# Altium schematic sheet Peripheral_Section.SchDoc
size A4; DocumentNumber: 8; SheetNumber: 8; SheetTotal: 17
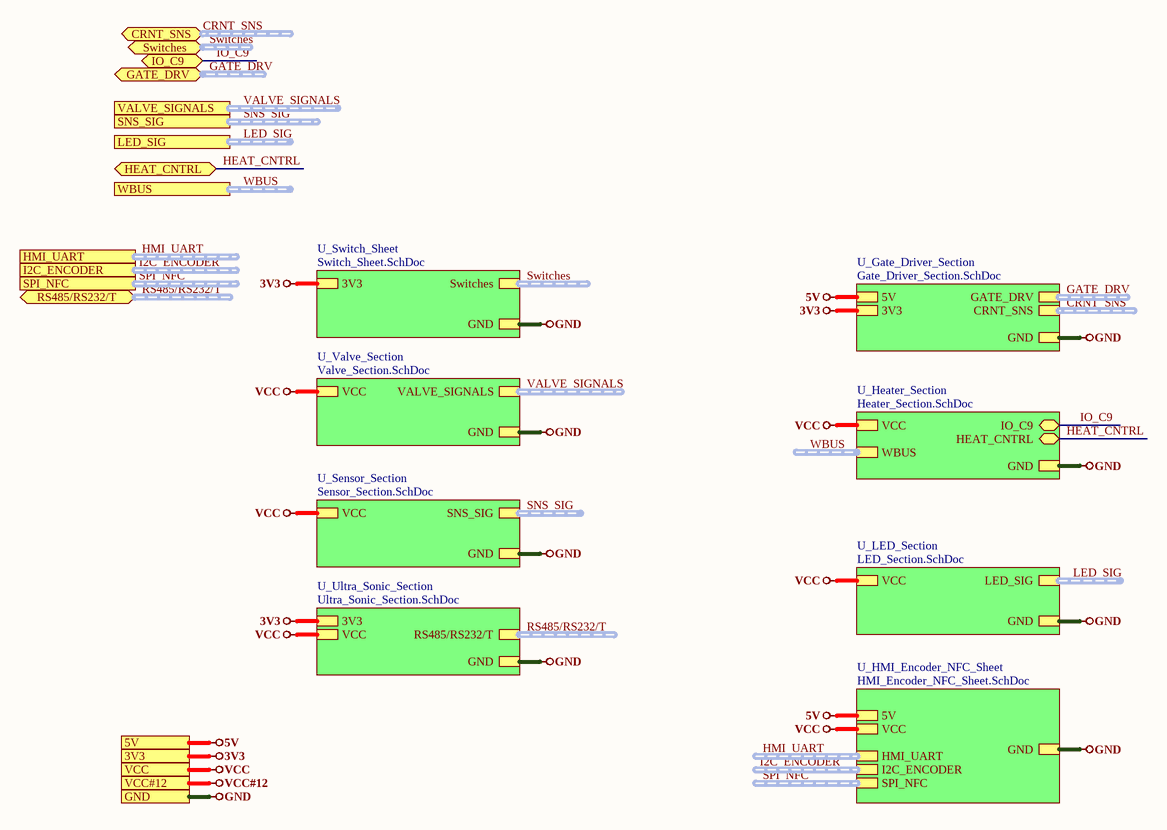
[diagram p0: Peripheral_Section.SchDoc]

## Sub-sheets
U_Gate_Driver_Section = Gate_Driver_Section.SchDoc: GATE_DRV (harness GATE_DRV), 5V, GND, CRNT_SNS (harness CRNT_SNS), 3V3
U_Heater_Section = Heater_Section.SchDoc: IO_C9 (bidir), VCC, GND, HEAT_CNTRL (bidir), WBUS (harness WBUS)
U_HMI_Encoder_NFC_Sheet = HMI_Encoder_NFC_Sheet.SchDoc: 5V, GND, HMI_UART (harness HMI_UART), I2C_ENCODER (harness ENCODER), VCC, SPI_NFC (harness ENCODER)
U_LED_Section = LED_Section.SchDoc: LED_SIG (harness LED_SIG), VCC, GND
U_Sensor_Section = Sensor_Section.SchDoc: SNS_SIG (harness SNS_SIG), VCC, GND
U_Switch_Sheet = Switch_Sheet.SchDoc: Switches (harness Switches), GND, 3V3
U_Ultra_Sonic_Section = Ultra_Sonic_Section.SchDoc: GND, 3V3, RS485/RS232/T (harness RS485/RS232/T), VCC
U_Valve_Section = Valve_Section.SchDoc: VALVE_SIGNALS (harness VALVE_SIGNALS), VCC, GND

## Ports
3V3, 5V, CRNT_SNS (bidir, harness CRNT_SNS), GATE_DRV (bidir, harness GATE_DRV), GND, HEAT_CNTRL (bidir), HMI_UART (harness VALVE_SIGNALS), I2C_ENCODER (harness VALVE_SIGNALS), IO_C9 (bidir), LED_SIG (harness LED_SIG), RS485/RS232/T (bidir, harness RS485/RS232/T), SNS_SIG (harness SNS_SIG), SPI_NFC (harness VALVE_SIGNALS), Switches (bidir, harness Switches), VALVE_SIGNALS (harness VALVE_SIGNALS), VCC, VCC#12, WBUS (harness WBUS)

## Nets
3V3: port 3V3, sheet U_Switch_Sheet/3V3, sheet U_Gate_Driver_Section/3V3, sheet U_Ultra_Sonic_Section/3V3
5V: port 5V, sheet U_Gate_Driver_Section/5V, sheet U_HMI_Encoder_NFC_Sheet/5V
GND: port GND, sheet U_Switch_Sheet/GND, sheet U_Gate_Driver_Section/GND, sheet U_Heater_Section/GND, sheet U_Sensor_Section/GND, sheet U_LED_Section/GND, sheet U_Valve_Section/GND, sheet U_HMI_Encoder_NFC_Sheet/GND, sheet U_Ultra_Sonic_Section/GND
VCC: port VCC, sheet U_Heater_Section/VCC, sheet U_Sensor_Section/VCC, sheet U_LED_Section/VCC, sheet U_Valve_Section/VCC, sheet U_HMI_Encoder_NFC_Sheet/VCC, sheet U_Ultra_Sonic_Section/VCC
VCC#12: port VCC#12
HEAT_CNTRL: port HEAT_CNTRL, sheet U_Heater_Section/HEAT_CNTRL
IO_C9: port IO_C9, sheet U_Heater_Section/IO_C9

## Buses and harness runs
harness CRNT_SNS = port CRNT_SNS
harness CRNT_SNS = sheet U_Gate_Driver_Section/CRNT_SNS
harness GATE_DRV = port GATE_DRV
harness GATE_DRV = sheet U_Gate_Driver_Section/GATE_DRV
harness HMI_UART = port HMI_UART
harness HMI_UART = sheet U_HMI_Encoder_NFC_Sheet/HMI_UART
harness I2C_ENCODER = port I2C_ENCODER
harness I2C_ENCODER = sheet U_HMI_Encoder_NFC_Sheet/I2C_ENCODER
harness LED_SIG = port LED_SIG
harness LED_SIG = sheet U_LED_Section/LED_SIG
harness RS485/RS232/T = port RS485/RS232/T
harness RS485/RS232/T = sheet U_Ultra_Sonic_Section/RS485/RS232/T
harness SNS_SIG = port SNS_SIG
harness SNS_SIG = sheet U_Sensor_Section/SNS_SIG
harness SPI_NFC = port SPI_NFC
harness SPI_NFC = sheet U_HMI_Encoder_NFC_Sheet/SPI_NFC
harness Switches = port Switches
harness Switches = sheet U_Switch_Sheet/Switches
harness VALVE_SIGNALS = port VALVE_SIGNALS
harness VALVE_SIGNALS = sheet U_Valve_Section/VALVE_SIGNALS
harness WBUS = port WBUS
harness WBUS = sheet U_Heater_Section/WBUS